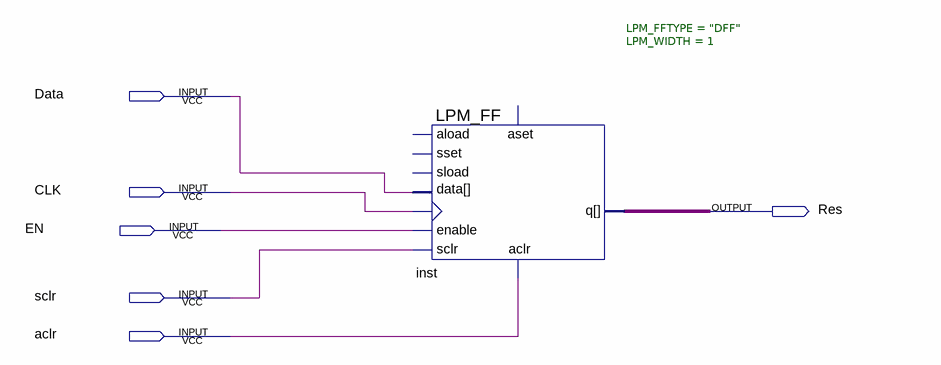
[diagram p0: schematic sheet]
// Quartus schematic PReg1.bdf as structural Verilog: 1 symbols, 6 pins
module PReg1 (
  input  Data,
  input  CLK,
  input  EN,
  input  sclr,
  input  aclr,
  output Res
);

  LPM_FF #(.LPM_FFTYPE("DFF"), .LPM_WIDTH(1)) inst (
    .enable(EN), .clock(CLK), .sclr(sclr), .aclr(aclr), .data(Data), .q(Res));  // open: aload, sset, sload, aset
endmodule
